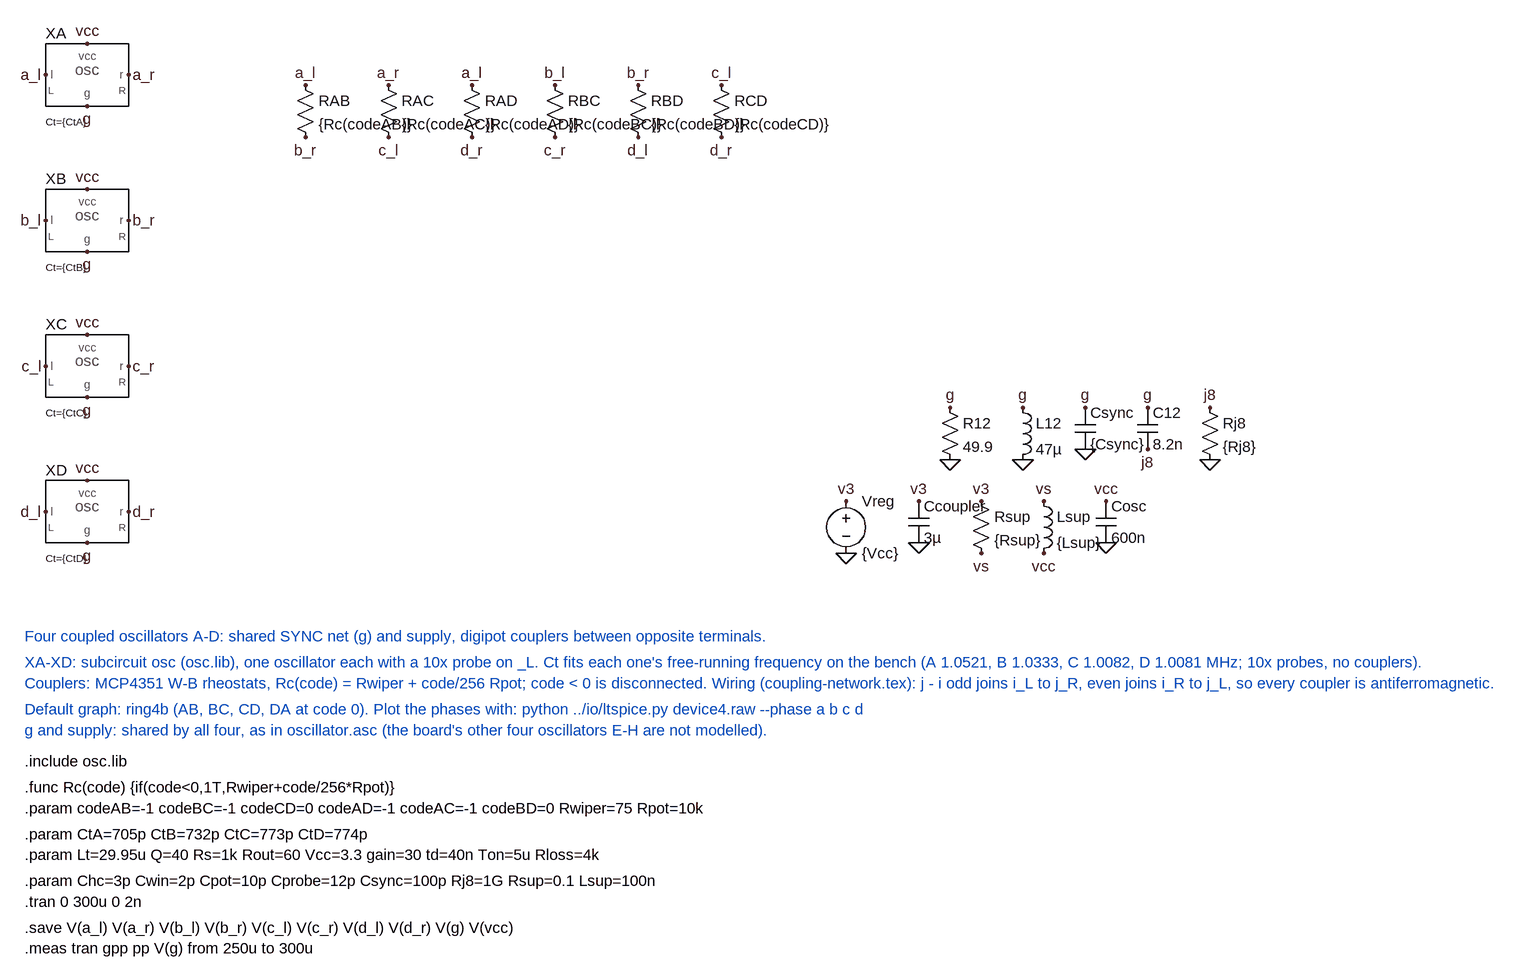
[diagram p0: schematic device4.asc]
device4.asc, the LTspice schematic file:
Version 4
SHEET 1 2204 1400
FLAG -64 0 a_l
FLAG 64 0 a_r
FLAG 0 -48 vcc
FLAG 0 48 g
FLAG -64 224 b_l
FLAG 64 224 b_r
FLAG 0 176 vcc
FLAG 0 272 g
FLAG -64 448 c_l
FLAG 64 448 c_r
FLAG 0 400 vcc
FLAG 0 496 g
FLAG -64 672 d_l
FLAG 64 672 d_r
FLAG 0 624 vcc
FLAG 0 720 g
FLAG 336 16 a_l
FLAG 336 96 b_r
FLAG 464 16 a_r
FLAG 464 96 c_l
FLAG 592 16 a_l
FLAG 592 96 d_r
FLAG 720 16 b_l
FLAG 720 96 c_r
FLAG 848 16 b_r
FLAG 848 96 d_l
FLAG 976 16 c_l
FLAG 976 96 d_r
FLAG 1168 656 v3
FLAG 1168 736 0
FLAG 1280 656 v3
FLAG 1280 720 0
FLAG 1376 656 v3
FLAG 1376 736 vs
FLAG 1472 656 vs
FLAG 1472 736 vcc
FLAG 1568 656 vcc
FLAG 1568 720 0
FLAG 1328 512 g
FLAG 1328 592 0
FLAG 1440 512 g
FLAG 1440 592 0
FLAG 1536 512 g
FLAG 1536 576 0
FLAG 1632 512 g
FLAG 1632 576 j8
FLAG 1728 512 j8
FLAG 1728 592 0
SYMBOL osc 0 0 R0
SYMATTR InstName XA
SYMATTR SpiceLine Ct={CtA}
SYMBOL osc 0 224 R0
SYMATTR InstName XB
SYMATTR SpiceLine Ct={CtB}
SYMBOL osc 0 448 R0
SYMATTR InstName XC
SYMATTR SpiceLine Ct={CtC}
SYMBOL osc 0 672 R0
SYMATTR InstName XD
SYMATTR SpiceLine Ct={CtD}
SYMBOL res 320 0 R0
SYMATTR InstName RAB
SYMATTR Value {Rc(codeAB)}
SYMBOL res 448 0 R0
SYMATTR InstName RAC
SYMATTR Value {Rc(codeAC)}
SYMBOL res 576 0 R0
SYMATTR InstName RAD
SYMATTR Value {Rc(codeAD)}
SYMBOL res 704 0 R0
SYMATTR InstName RBC
SYMATTR Value {Rc(codeBC)}
SYMBOL res 832 0 R0
SYMATTR InstName RBD
SYMATTR Value {Rc(codeBD)}
SYMBOL res 960 0 R0
SYMATTR InstName RCD
SYMATTR Value {Rc(codeCD)}
SYMBOL voltage 1168 640 R0
SYMATTR InstName Vreg
SYMATTR Value {Vcc}
SYMBOL cap 1264 656 R0
SYMATTR InstName Ccoupler
SYMATTR Value 3µ
SYMBOL res 1360 640 R0
SYMATTR InstName Rsup
SYMATTR Value {Rsup}
SYMBOL ind 1456 640 R0
SYMATTR InstName Lsup
SYMATTR Value {Lsup}
SYMBOL cap 1552 656 R0
SYMATTR InstName Cosc
SYMATTR Value 600n
SYMBOL res 1312 496 R0
SYMATTR InstName R12
SYMATTR Value 49.9
SYMBOL ind 1424 496 R0
SYMATTR InstName L12
SYMATTR Value 47µ
SYMBOL cap 1520 512 R0
SYMATTR InstName Csync
SYMATTR Value {Csync}
SYMBOL cap 1616 512 R0
SYMATTR InstName C12
SYMATTR Value 8.2n
SYMBOL res 1712 496 R0
SYMATTR InstName Rj8
SYMATTR Value {Rj8}
TEXT -96 864 Left 2 ;Four coupled oscillators A-D: shared SYNC net (g) and supply, digipot couplers between opposite terminals.
TEXT -96 904 Left 2 ;XA-XD: subcircuit osc (osc.lib), one oscillator each with a 10x probe on _L. Ct fits each one's free-running frequency on the bench (A 1.0521, B 1.0333, C 1.0082, D 1.0081 MHz; 10x probes, no couplers).
TEXT -96 936 Left 2 ;Couplers: MCP4351 W-B rheostats, Rc(code) = Rwiper + code/256 Rpot; code < 0 is disconnected. Wiring (coupling-network.tex): j - i odd joins i_L to j_R, even joins i_R to j_L, so every coupler is antiferromagnetic.
TEXT -96 976 Left 2 ;Default graph: ring4b (AB, BC, CD, DA at code 0). Plot the phases with: python ../io/ltspice.py device4.raw --phase a b c d
TEXT -96 1008 Left 2 ;g and supply: shared by all four, as in oscillator.asc (the board's other four oscillators E-H are not modelled).
TEXT -96 1056 Left 2 !.include osc.lib
TEXT -96 1096 Left 2 !.func Rc(code) {if(code<0,1T,Rwiper+code/256*Rpot)}
TEXT -96 1128 Left 2 !.param codeAB=-1 codeBC=-1 codeCD=0 codeAD=-1 codeAC=-1 codeBD=0 Rwiper=75 Rpot=10k
TEXT -96 1168 Left 2 !.param CtA=705p CtB=732p CtC=773p CtD=774p
TEXT -96 1200 Left 2 !.param Lt=29.95u Q=40 Rs=1k Rout=60 Vcc=3.3 gain=30 td=40n Ton=5u Rloss=4k
TEXT -96 1240 Left 2 !.param Chc=3p Cwin=2p Cpot=10p Cprobe=12p Csync=100p Rj8=1G Rsup=0.1 Lsup=100n
TEXT -96 1272 Left 2 !.tran 0 300u 0 2n
TEXT -96 1312 Left 2 !.save V(a_l) V(a_r) V(b_l) V(b_r) V(c_l) V(c_r) V(d_l) V(d_r) V(g) V(vcc)
TEXT -96 1344 Left 2 !.meas tran gpp pp V(g) from 250u to 300u

The netlist it stands for:
* device4.asc
XXA a_l a_r vcc g osc Ct={CtA}  ; pins l r vcc g
XXB b_l b_r vcc g osc Ct={CtB}  ; pins l r vcc g
XXC c_l c_r vcc g osc Ct={CtC}  ; pins l r vcc g
XXD d_l d_r vcc g osc Ct={CtD}  ; pins l r vcc g
RAB a_l b_r {Rc(codeAB)}
RAC a_r c_l {Rc(codeAC)}
RAD a_l d_r {Rc(codeAD)}
RBC b_l c_r {Rc(codeBC)}
RBD b_r d_l {Rc(codeBD)}
RCD c_l d_r {Rc(codeCD)}
Vreg v3 0 {Vcc}
Ccoupler v3 0 3µ
Rsup v3 vs {Rsup}
Lsup vs vcc {Lsup}
Cosc vcc 0 600n
R12 g 0 49.9
L12 g 0 47µ
Csync g 0 {Csync}
C12 g j8 8.2n
Rj8 j8 0 {Rj8}
* Four coupled oscillators A-D: shared SYNC net (g) and supply, digipot couplers between opposite terminals.
* XA-XD: subcircuit osc (osc.lib), one oscillator each with a 10x probe on _L. Ct fits each one's free-running frequency on the bench (A 1.0521, B 1.0333, C 1.0082, D 1.0081 MHz; 10x probes, no couplers).
* Couplers: MCP4351 W-B rheostats, Rc(code) = Rwiper + code/256 Rpot; code < 0 is disconnected. Wiring (coupling-network.tex): j - i odd joins i_L to j_R, even joins i_R to j_L, so every coupler is antiferromagnetic.
* Default graph: ring4b (AB, BC, CD, DA at code 0). Plot the phases with: python ../io/ltspice.py device4.raw --phase a b c d
* g and supply: shared by all four, as in oscillator.asc (the board's other four oscillators E-H are not modelled).
.include osc.lib
.func Rc(code) {if(code<0,1T,Rwiper+code/256*Rpot)}
.param codeAB=-1 codeBC=-1 codeCD=0 codeAD=-1 codeAC=-1 codeBD=0 Rwiper=75 Rpot=10k
.param CtA=705p CtB=732p CtC=773p CtD=774p
.param Lt=29.95u Q=40 Rs=1k Rout=60 Vcc=3.3 gain=30 td=40n Ton=5u Rloss=4k
.param Chc=3p Cwin=2p Cpot=10p Cprobe=12p Csync=100p Rj8=1G Rsup=0.1 Lsup=100n
.tran 0 300u 0 2n
.save V(a_l) V(a_r) V(b_l) V(b_r) V(c_l) V(c_r) V(d_l) V(d_r) V(g) V(vcc)
.meas tran gpp pp V(g) from 250u to 300u
.backanno
.end